# Altium schematic sheet 1700-0002_InterfaceBoard_RevA_0.SchDoc: 1700-0002_InterfaceBoard_RevA
size 897 x 577 mm; DRAWING_DATE: 4/15/2022; DRAWING_TITLE: PQI380 UNIV. INTERFACE BRD; PART_NUMBER: 7000-0303; REV: R12; Origin: Eagle; Date: 7/13/2023 2:16:40 PM; SheetNumber: 1; DWG-CO-NAME: DWG-CO-NAME; DWG-DATE: DWG-DATE; DWG-NUMBER: DWG-NUMBER; DWG-REV: DWG-REV; DWG-TITLE: DWG-TITLE; SIZE: SIZE; GateName_1: G$1; SymbolName_1: FRAME_D_L; LibraryName: frames; DeviceSetName: FRAME_D_L; Sheet: Sheet:
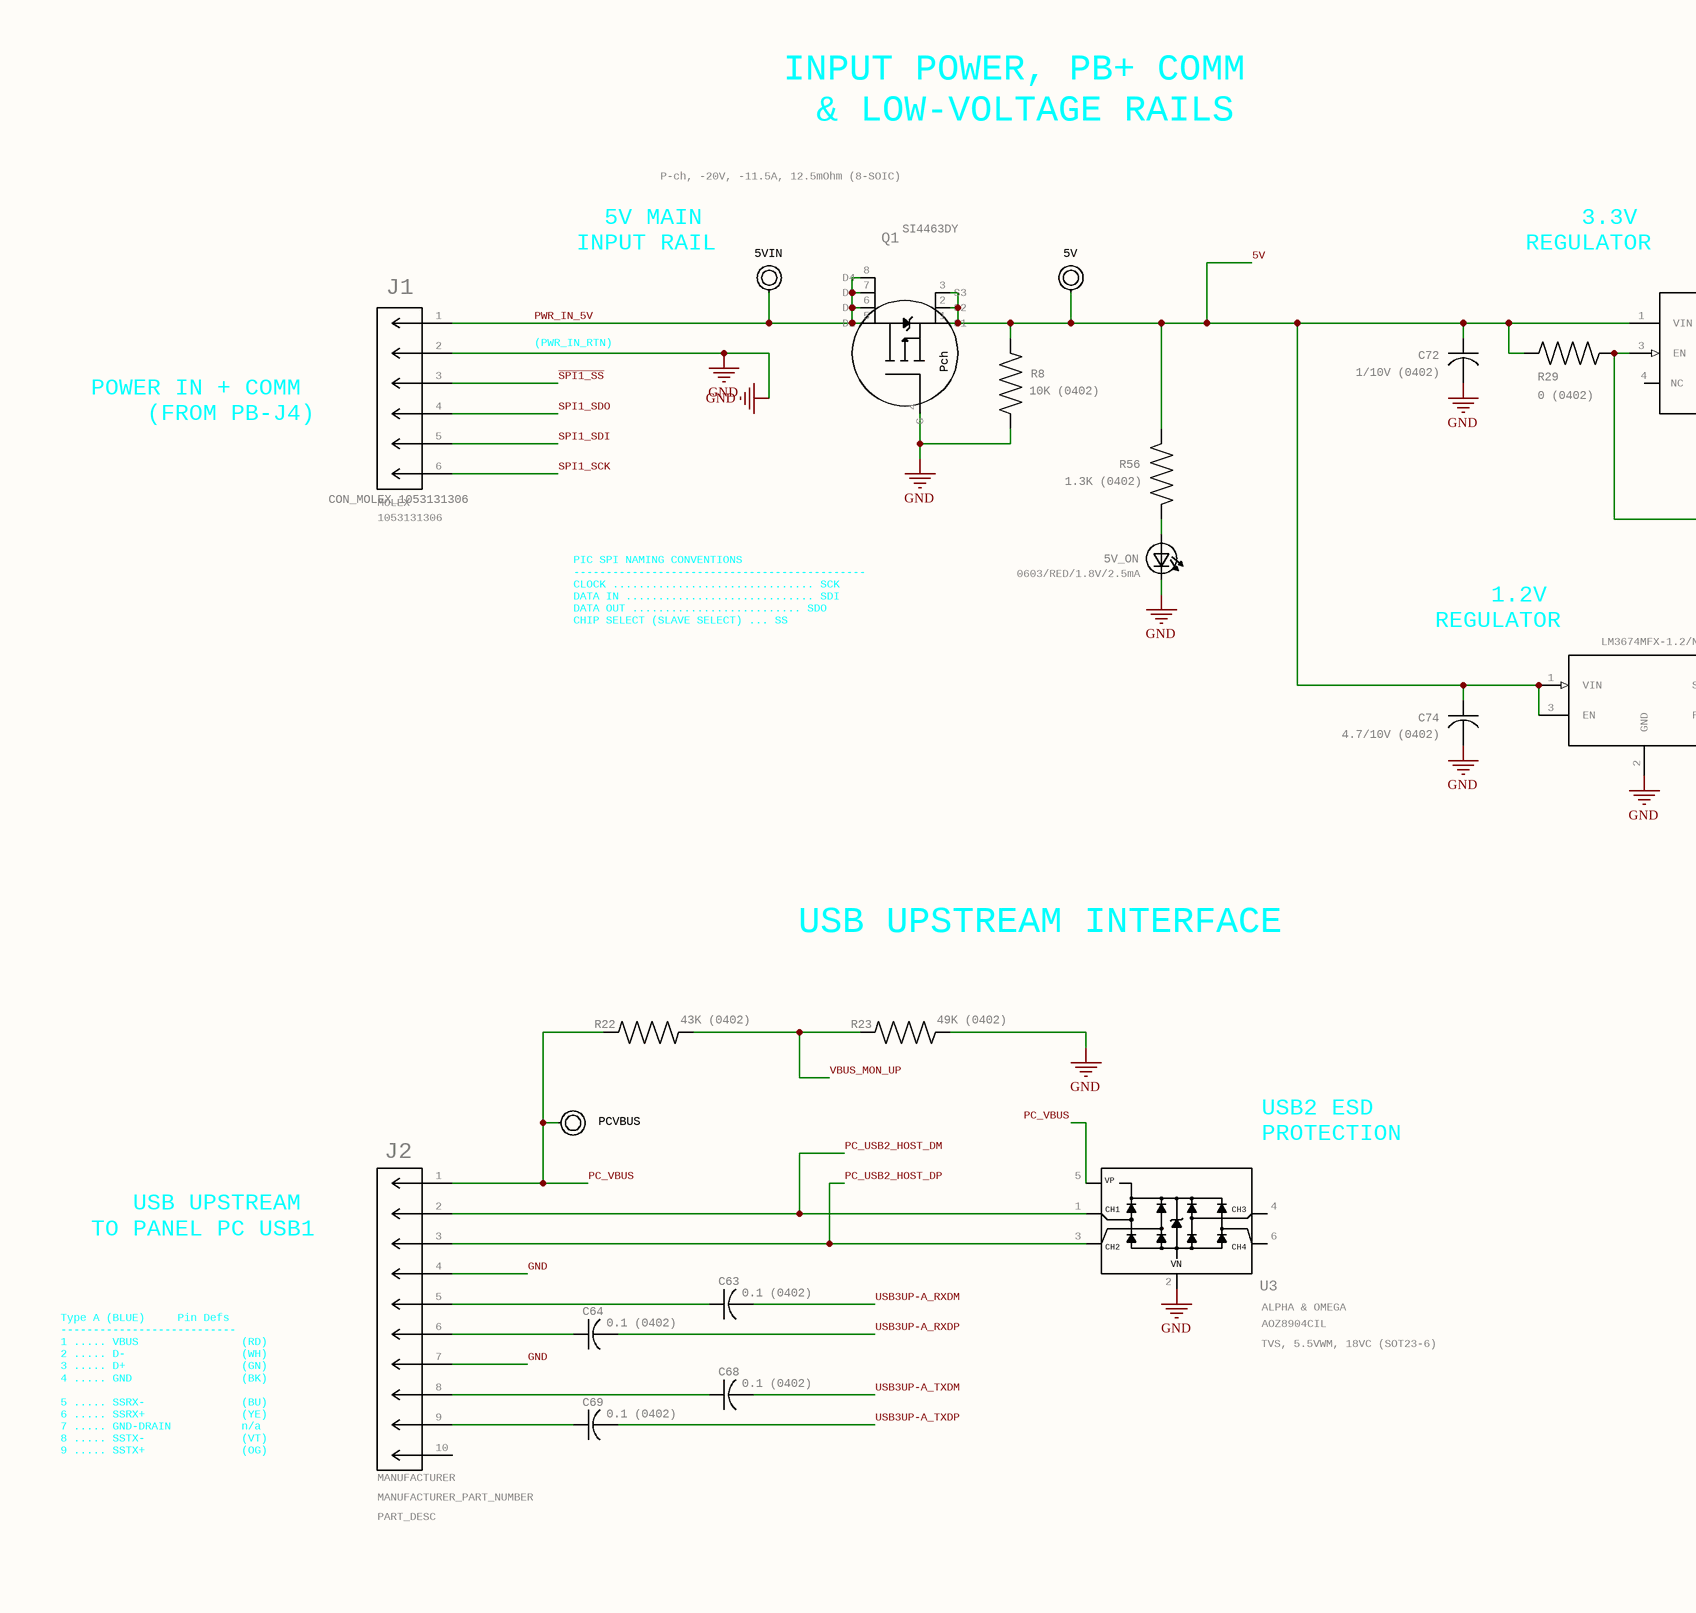
[diagram p0: 1700-0002_InterfaceBoard_RevA_0.SchDoc, top left]
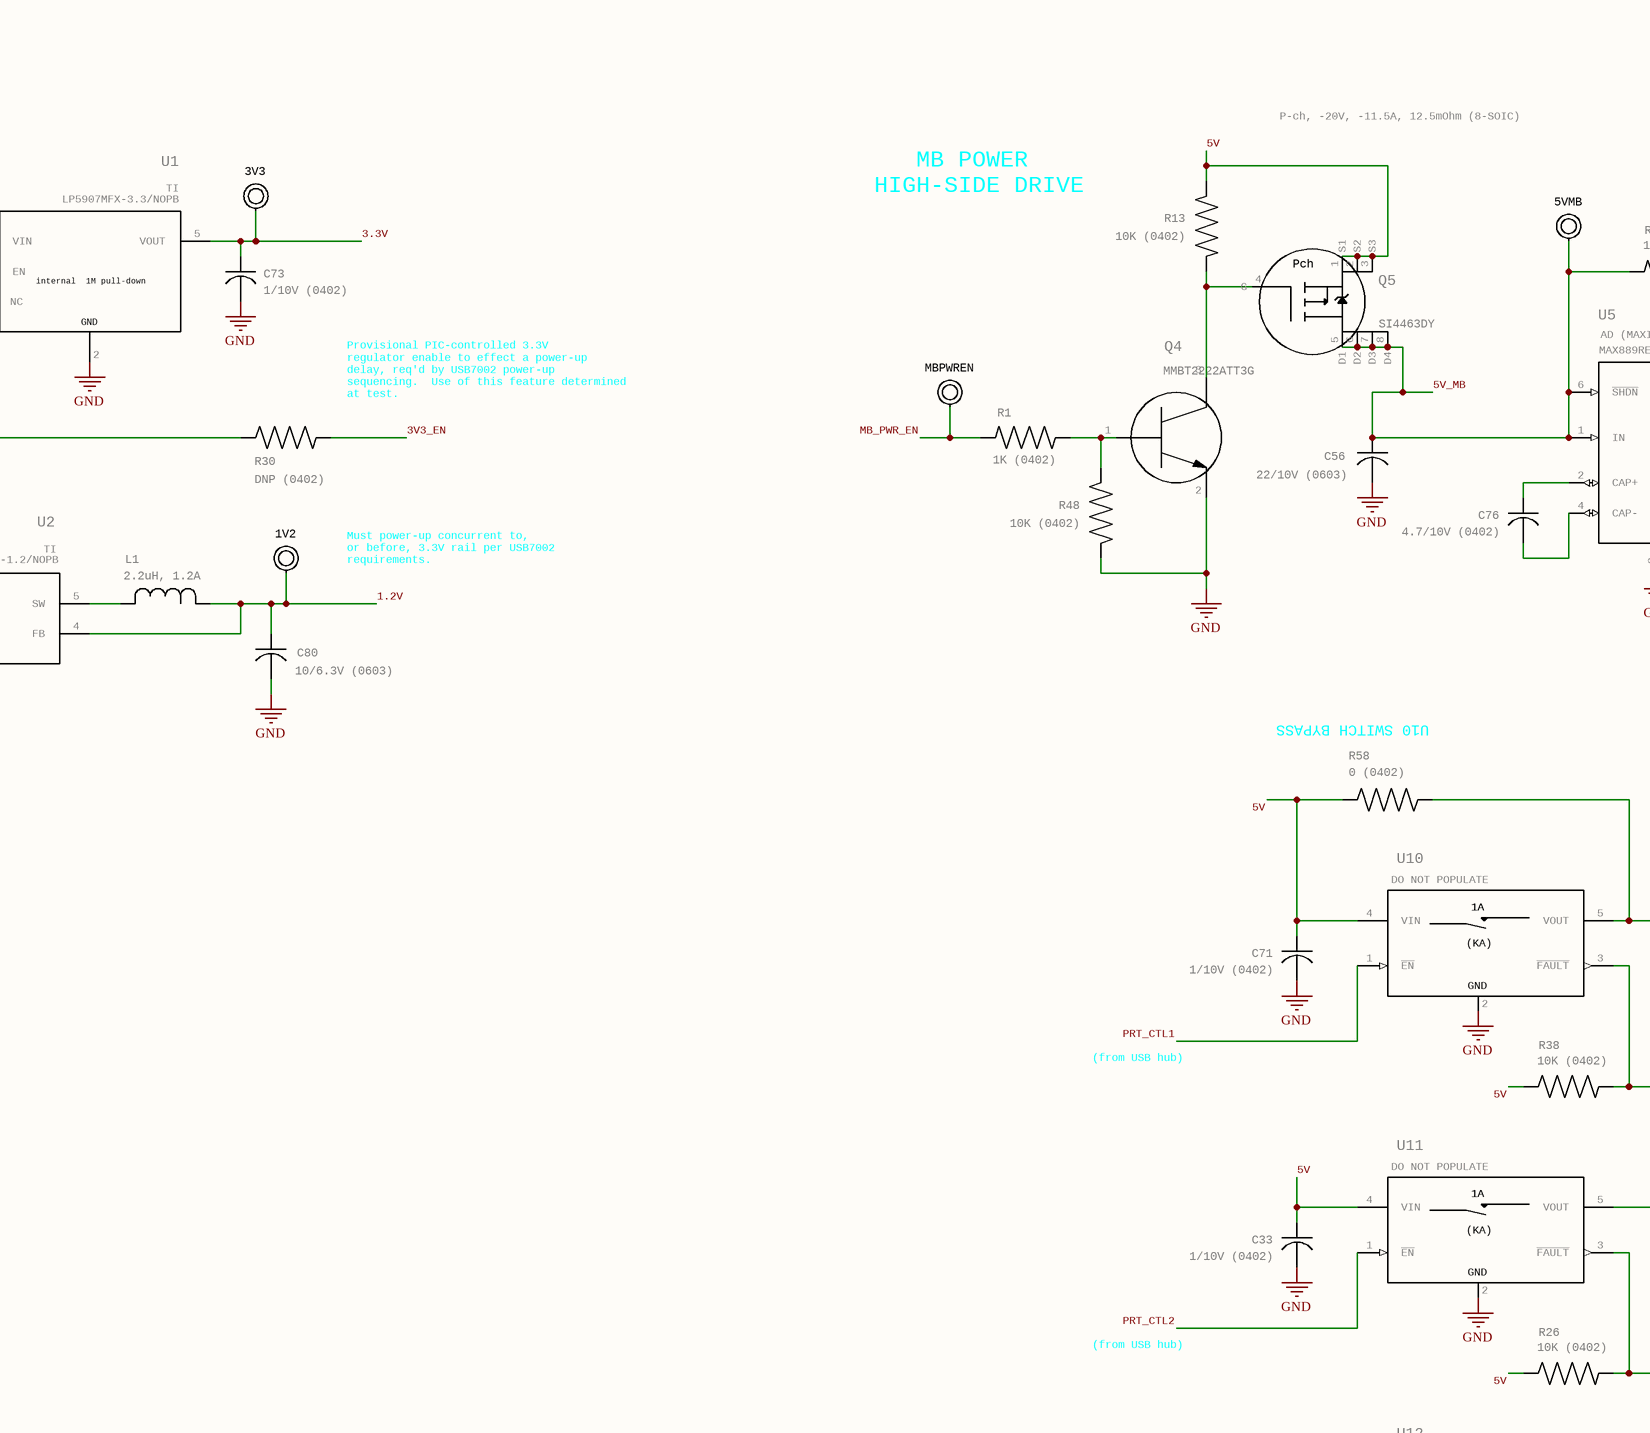
[diagram p1: 1700-0002_InterfaceBoard_RevA_0.SchDoc, top middle]
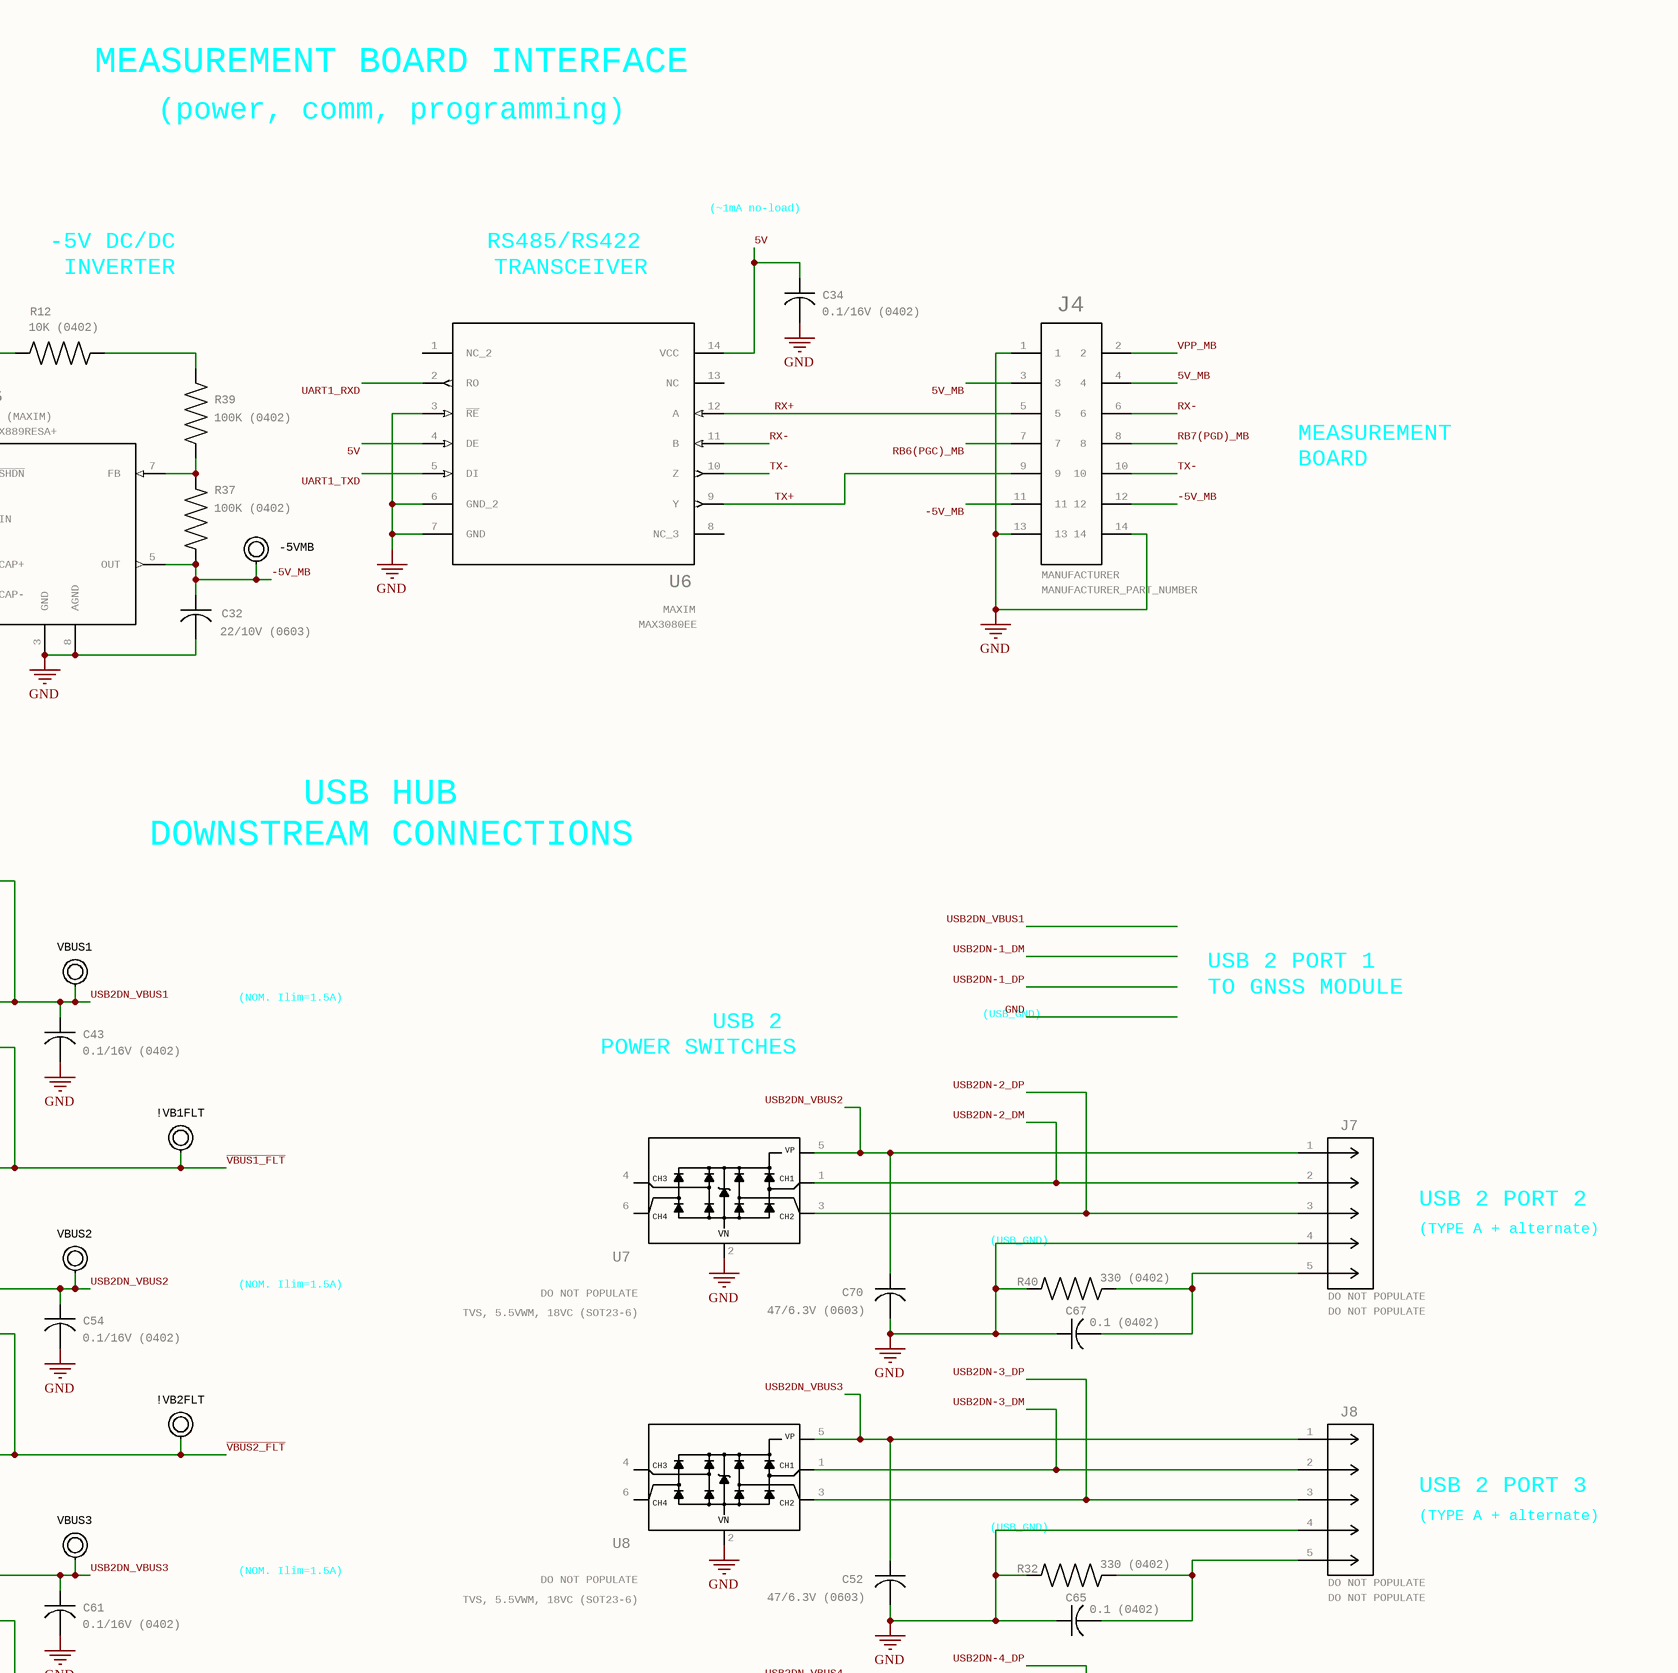
[diagram p2: 1700-0002_InterfaceBoard_RevA_0.SchDoc, top right]
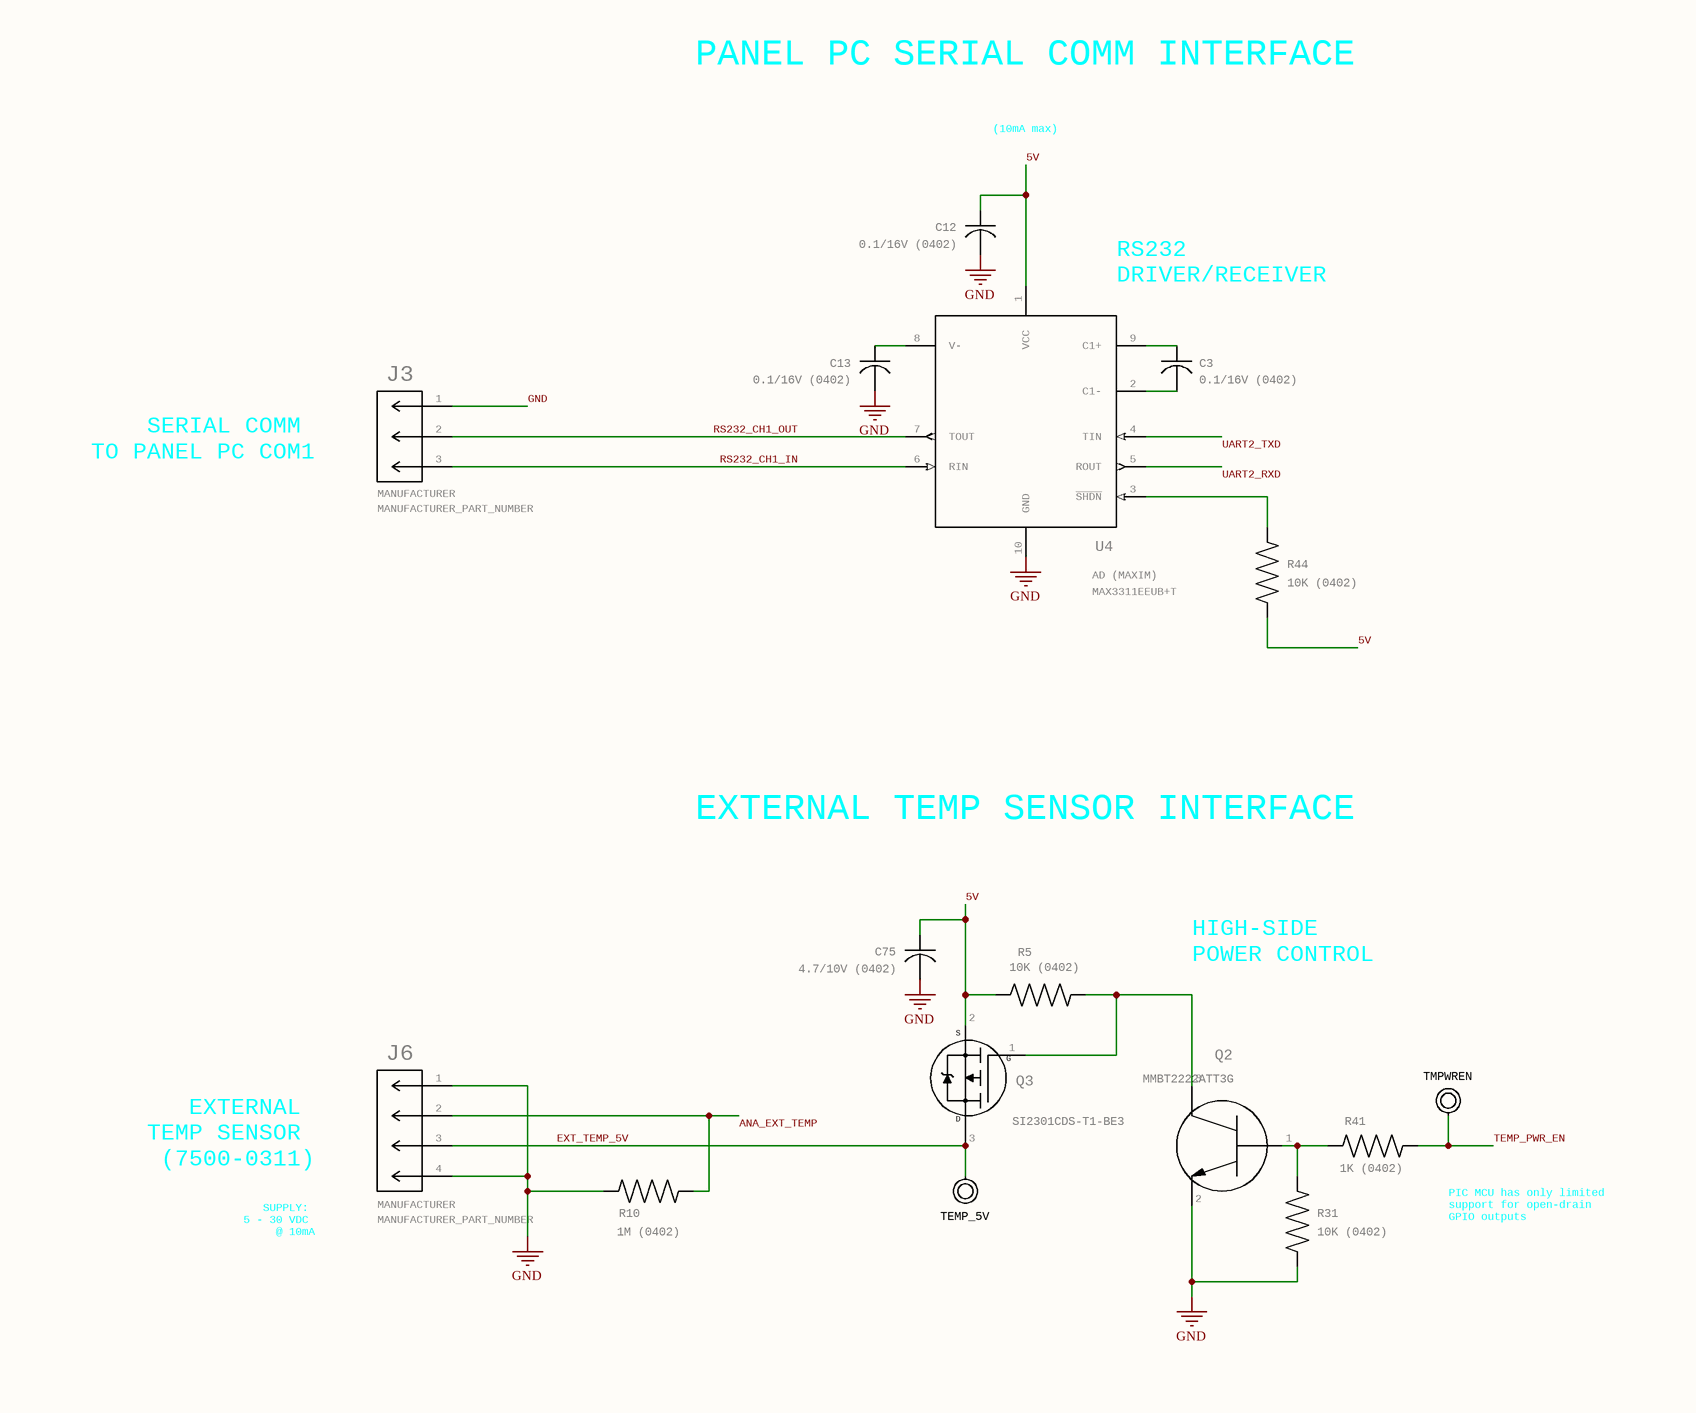
[diagram p3: 1700-0002_InterfaceBoard_RevA_0.SchDoc, bottom left]
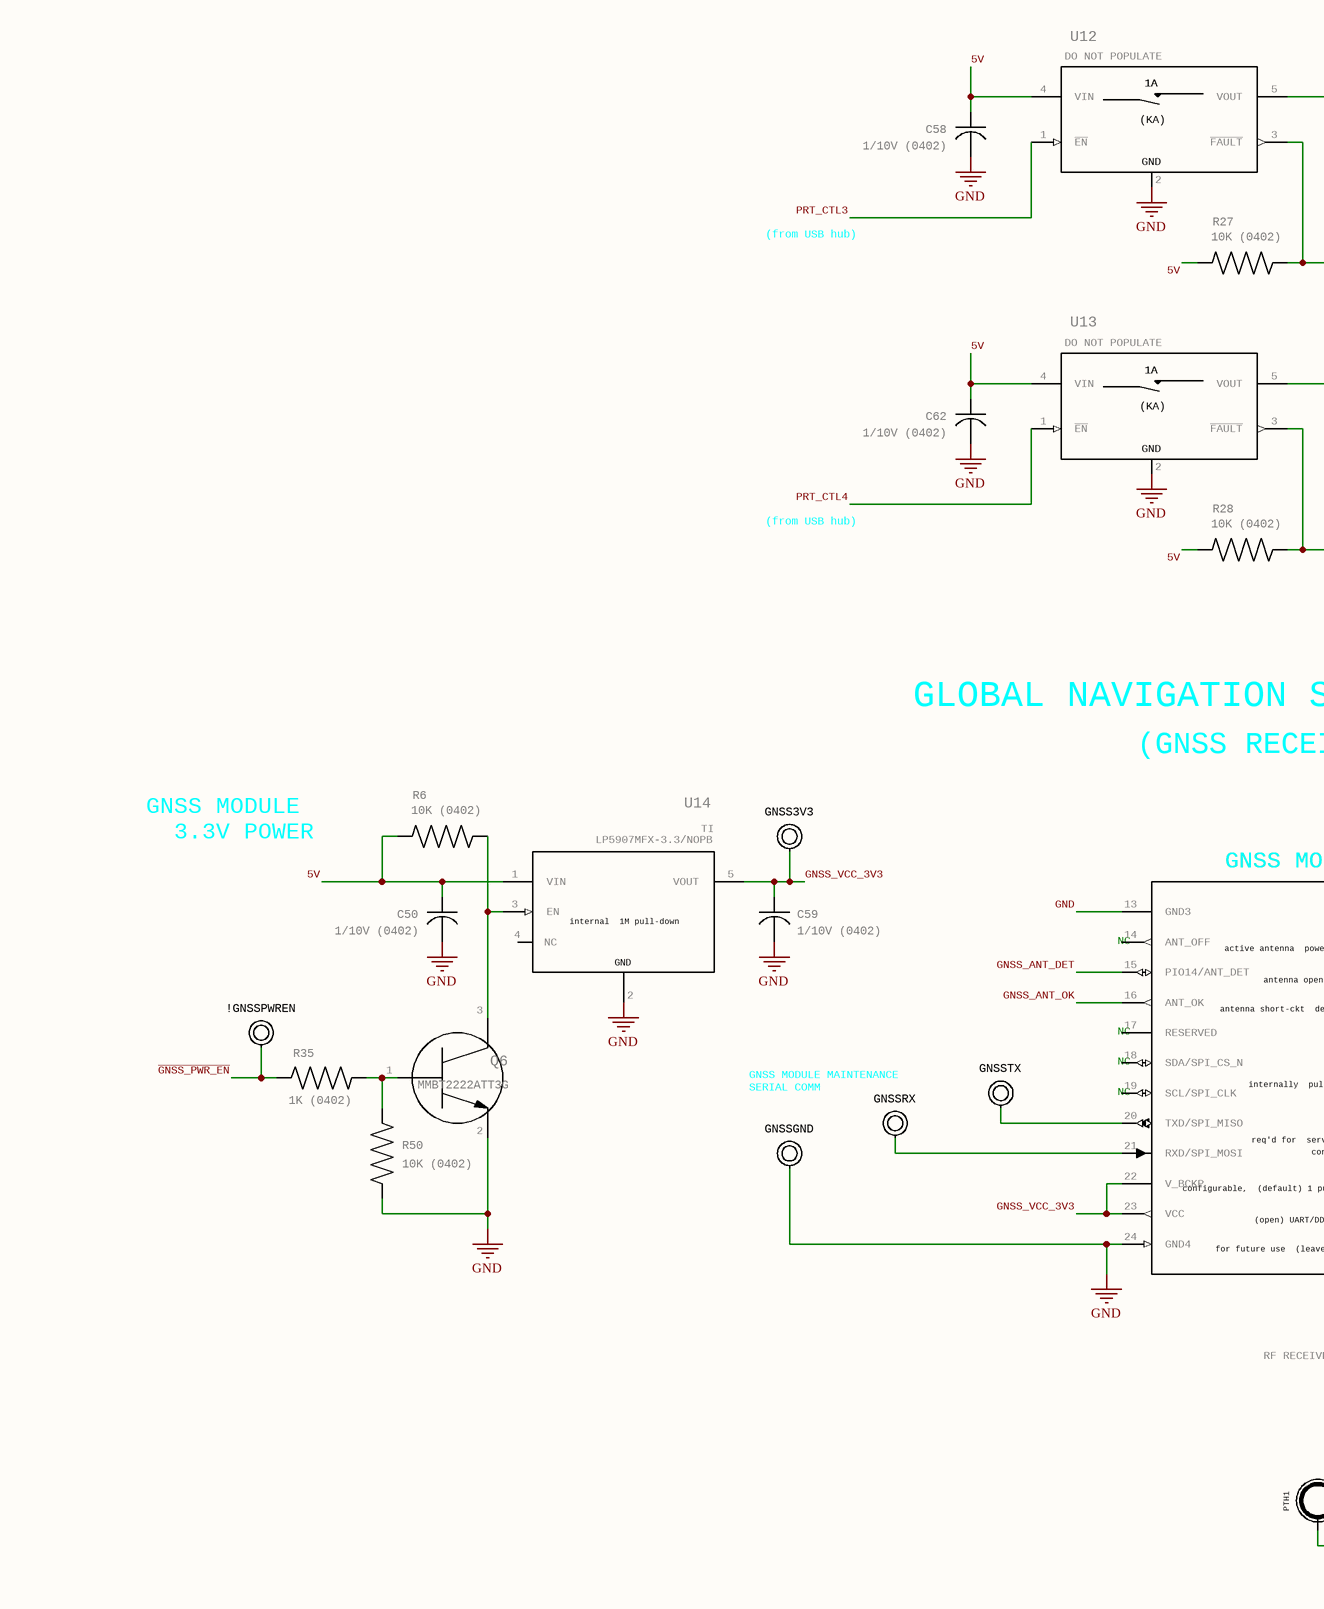
[diagram p4: 1700-0002_InterfaceBoard_RevA_0.SchDoc, bottom middle]
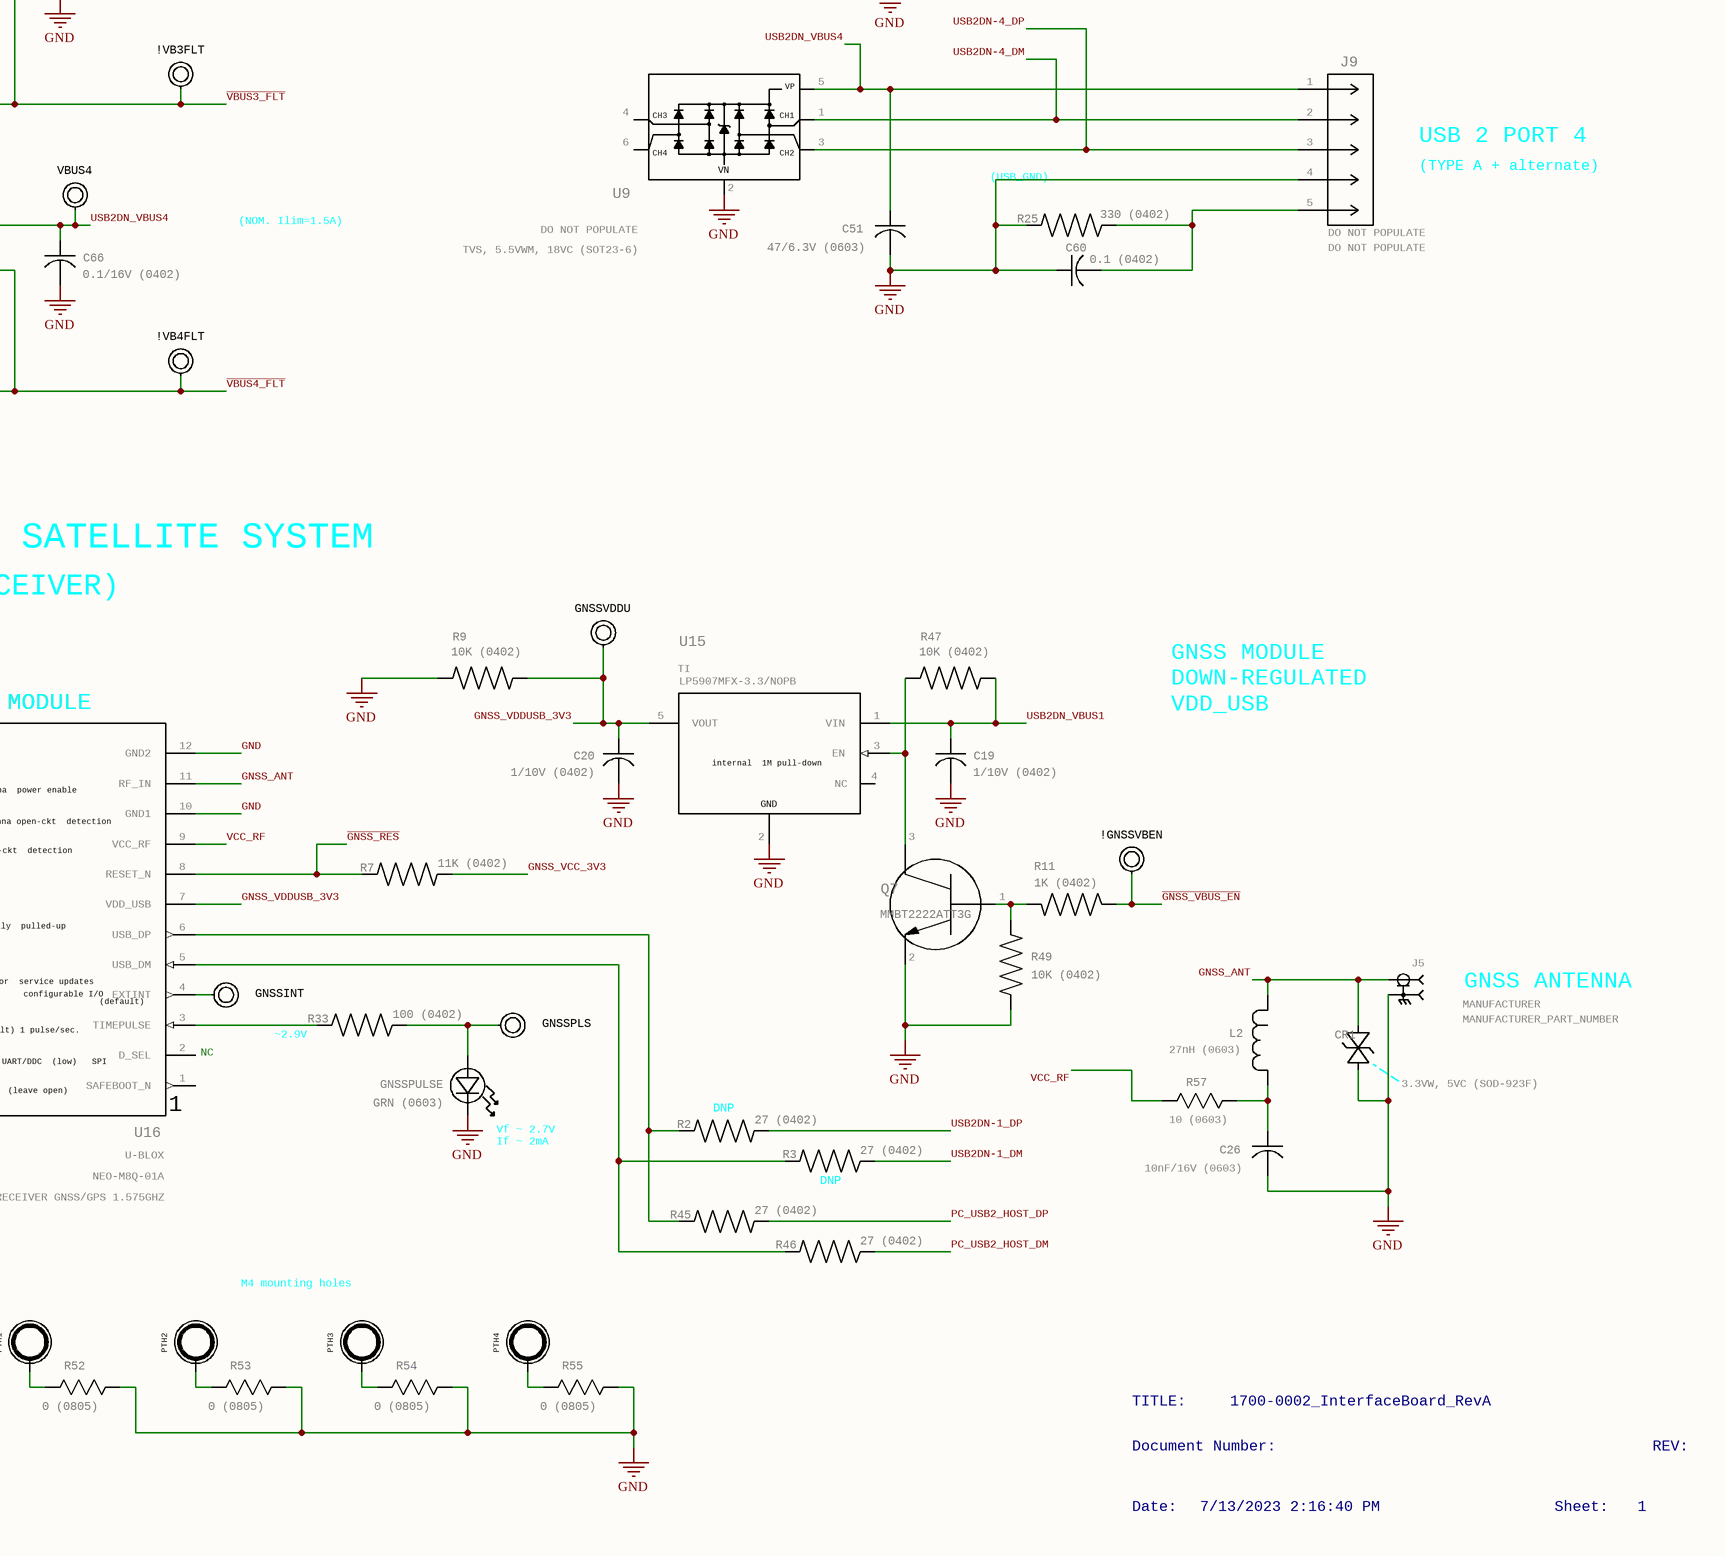
[diagram p5: 1700-0002_InterfaceBoard_RevA_0.SchDoc, bottom right]

## Parts
1V2  TST_POINT_PTH_042-OCT  [TST_POINT_PTH_042-OCT]  (value not drawn)
3V3  TST_POINT_PTH_042-OCT  [TST_POINT_PTH_042-OCT]  (value not drawn)
5V  TST_POINT_PTH_042-OCT  [TST_POINT_PTH_042-OCT]  (value not drawn)
5V_ON  0603/RED/1.8V/2.5mA  [LED_0603_LITE-ON]
5VIN  TST_POINT_PTH_042-OCT  [TST_POINT_PTH_042-OCT]  (value not drawn)
5VMB  TST_POINT_PTH_042-OCT  [TST_POINT_PTH_042-OCT]  (value not drawn)
!GNSSPWREN  TST_POINT_PTH_042-OCT  [TST_POINT_PTH_042-OCT]  (value not drawn)
!GNSSVBEN  TST_POINT_PTH_042-OCT  [TST_POINT_PTH_042-OCT]  (value not drawn)
!VB1FLT  TST_POINT_PTH_042-OCT  [TST_POINT_PTH_042-OCT]  (value not drawn)
!VB2FLT  TST_POINT_PTH_042-OCT  [TST_POINT_PTH_042-OCT]  (value not drawn)
!VB3FLT  TST_POINT_PTH_042-OCT  [TST_POINT_PTH_042-OCT]  (value not drawn)
!VB4FLT  TST_POINT_PTH_042-OCT  [TST_POINT_PTH_042-OCT]  (value not drawn)
-5VMB  TST_POINT_PTH_042-OCT  [TST_POINT_PTH_042-OCT]  (value not drawn)
C3  0.1/16V (0402)  [G-155_MUR]
C12  0.1/16V (0402)  [G-155_MUR]
C13  0.1/16V (0402)  [G-155_MUR]
C19  1/10V (0402)  [G-155_MUR]
C20  1/10V (0402)  [G-155_MUR]
C26  10nF/16V (0603)  [CAP_C1608_TDK]
C32  22/10V (0603)  [CAP_C1608_TDK]
C33  1/10V (0402)  [G-155_MUR]
C34  0.1/16V (0402)  [G-155_MUR]
C43  0.1/16V (0402)  [G-155_MUR]
C50  1/10V (0402)  [G-155_MUR]
C51  47/6.3V (0603)  [CAP_C1608_TDK]
C52  47/6.3V (0603)  [CAP_C1608_TDK]
C54  0.1/16V (0402)  [G-155_MUR]
C56  22/10V (0603)  [CAP_C1608_TDK]
C58  1/10V (0402)  [G-155_MUR]
C59  1/10V (0402)  [G-155_MUR]
C60  0.1 (0402)  [G-155_MUR]
C61  0.1/16V (0402)  [G-155_MUR]
C62  1/10V (0402)  [G-155_MUR]
C63  0.1 (0402)  [G-155_MUR]
C64  0.1 (0402)  [G-155_MUR]
C65  0.1 (0402)  [G-155_MUR]
C66  0.1/16V (0402)  [G-155_MUR]
C67  0.1 (0402)  [G-155_MUR]
C68  0.1 (0402)  [G-155_MUR]
C69  0.1 (0402)  [G-155_MUR]
C70  47/6.3V (0603)  [CAP_C1608_TDK]
C71  1/10V (0402)  [G-155_MUR]
C72  1/10V (0402)  [G-155_MUR]
C73  1/10V (0402)  [G-155_MUR]
C74  4.7/10V (0402)  [G-155_MUR]
C75  4.7/10V (0402)  [G-155_MUR]
C76  4.7/10V (0402)  [G-155_MUR]
C80  10/6.3V (0603)  [CAP_C1608_TDK]
CR1  3.3VW, 5VC (SOD-923F)  [SOD-923F_COMCHIP]
GNSS3V3  TST_POINT_PTH_042-OCT  [TST_POINT_PTH_042-OCT]  (value not drawn)
GNSSGND  TST_POINT_PTH_042-OCT  [TST_POINT_PTH_042-OCT]  (value not drawn)
GNSSINT  TST_POINT_PTH_042-OCT  [TST_POINT_PTH_042-OCT]  (value not drawn)
GNSSPLS  TST_POINT_PTH_042-OCT  [TST_POINT_PTH_042-OCT]  (value not drawn)
GNSSPULSE  GRN (0603)  [LED_DIALIGHT_598_DIA]
GNSSRX  TST_POINT_PTH_042-OCT  [TST_POINT_PTH_042-OCT]  (value not drawn)
GNSSTX  TST_POINT_PTH_042-OCT  [TST_POINT_PTH_042-OCT]  (value not drawn)
GNSSVDDU  TST_POINT_PTH_042-OCT  [TST_POINT_PTH_042-OCT]  (value not drawn)
J1  CON_MOLEX_1053131306  MANUFACTURER: MOLEX  MANUFACTURER_PART_NUMBER: 1053131306  [CON_1053131306]
J2  CON_MOLEX_1053141310  [CON_1053141310]  (value not drawn)
J3  CON_MOLEX_1053131303  [CON_1053131303]  (value not drawn)
J4  CON_3M_RA_N3314-5302RB  [3M_N3314-5302RB_RA]  (value not drawn)
J5  SAMTEC_SMA-J-P-X-ST-TH1_V.2  [SAMTEC_SMA-J-P-X-ST-TH1]  (value not drawn)
J6  CON_MOLEX_1053131304  [CON_1053131304]  (value not drawn)
J7  MANUFACTURER: DO NOT POPULATE  [CON_1054301305_MOL]  (hidden comment: CON_MOLEX_1054301305)
J8  MANUFACTURER: DO NOT POPULATE  [CON_1054301305_MOL]  (hidden comment: CON_MOLEX_1054301305)
J9  MANUFACTURER: DO NOT POPULATE  [CON_1054301305_MOL]  (hidden comment: CON_MOLEX_1054301305)
L1  2.2uH, 1.2A  [IND_TAIYO_NR3012_TAY]
L2  27nH (0603)  [INDUCTOR_0603_TDK]
MBPWREN  TST_POINT_PTH_042-OCT  [TST_POINT_PTH_042-OCT]  (value not drawn)
PCVBUS  TST_POINT_PTH_042-OCT  [TST_POINT_PTH_042-OCT]  (value not drawn)
PTH1  PTH_M4_4.5MM-ID_MIDDLE-FIT  [PTH_M4_4.5MM-ID]  (value not drawn)
PTH2  PTH_M4_4.5MM-ID_MIDDLE-FIT  [PTH_M4_4.5MM-ID]  (value not drawn)
PTH3  PTH_M4_4.5MM-ID_MIDDLE-FIT  [PTH_M4_4.5MM-ID]  (value not drawn)
PTH4  PTH_M4_4.5MM-ID_MIDDLE-FIT  [PTH_M4_4.5MM-ID]  (value not drawn)
Q1  P-ch, -20V, -11.5A, 12.5mOhm (8-SOIC)  MANUFACTURER_PART_NUMBER: SI4463DY  [SO-8L-NB_FAS]
Q2  MMBT2222ATT3G  [SC-75(SOT-416)_ONSEMI]
Q3  MANUFACTURER_PART_NUMBER: SI2301CDS-T1-BE3  [SOT_1CDS-T1-BE3_VIS]  (hidden comment: P-CH/-20V/-3A/0.09OHM)
Q4  MMBT2222ATT3G  [SC-75(SOT-416)_ONSEMI]
Q5  P-ch, -20V, -11.5A, 12.5mOhm (8-SOIC)  MANUFACTURER_PART_NUMBER: SI4463DY  [SO-8L-NB_FAS]
Q6  MMBT2222ATT3G  [SC-75(SOT-416)_ONSEMI]
Q7  MMBT2222ATT3G  [SC-75(SOT-416)_ONSEMI]
R1  1K (0402)  [RESC1005X35N]
R2  27 (0402)  [RESC1005X35N]
R3  27 (0402)  [RESC1005X35N]
R5  10K (0402)  [RESC1005X35N]
R6  10K (0402)  [RESC1005X35N]
R7  11K (0402)  [RESC1005X35N]
R8  10K (0402)  [RESC1005X35N]
R9  10K (0402)  [RESC1005X35N]
R10  1M (0402)  [RESC1005X35N]
R11  1K (0402)  [RESC1005X35N]
R12  10K (0402)  [RESC1005X35N]
R13  10K (0402)  [RESC1005X35N]
R22  43K (0402)  [RESC1005X35N]
R23  49K (0402)  [RESC1005X35N]
R25  330 (0402)  [RESC1005X35N]
R26  10K (0402)  [RESC1005X35N]
R27  10K (0402)  [RESC1005X35N]
R28  10K (0402)  [RESC1005X35N]
R29  0 (0402)  [RESC1005X35N]
R30  DNP (0402)  [RESC1005X35N]
R31  10K (0402)  [RESC1005X35N]
R32  330 (0402)  [RESC1005X35N]
R33  100 (0402)  [RESC1005X35N]
R35  1K (0402)  [RESC1005X35N]
R37  100K (0402)  [RESC1005X35N]
R38  10K (0402)  [RESC1005X35N]
R39  100K (0402)  [RESC1005X35N]
R40  330 (0402)  [RESC1005X35N]
R41  1K (0402)  [RESC1005X35N]
R44  10K (0402)  [RESC1005X35N]
R45  27 (0402)  [RESC1005X35N]
R46  27 (0402)  [RESC1005X35N]
R47  10K (0402)  [RESC1005X35N]
R48  10K (0402)  [RESC1005X35N]
R49  10K (0402)  [RESC1005X35N]
R50  10K (0402)  [RESC1005X35N]
R52  0 (0805)  [STA_HCJ0805_STP]
R53  0 (0805)  [STA_HCJ0805_STP]
R54  0 (0805)  [STA_HCJ0805_STP]
R55  0 (0805)  [STA_HCJ0805_STP]
R56  1.3K (0402)  [RESC1005X35N]
R57  10 (0603)  [STA_RMCF0603_STP]
R58  0 (0402)  [RESC1005X35N]
TEMP_5V  TST_POINT_PTH_042-OCT  [TST_POINT_PTH_042-OCT]  (value not drawn)
TMPWREN  TST_POINT_PTH_042-OCT  [TST_POINT_PTH_042-OCT]  (value not drawn)
U1  internal
1Mpull-down: internal / 1M pull-down  MANUFACTURER: TI  MANUFACTURER_PART_NUMBER: LP5907MFX-3.3/NOPB  [DBV0005A_L]  (hidden comment: TI_LP5907MFX-3.3/NOPBDBV0005A_L)
U2  MANUFACTURER: TI  MANUFACTURER_PART_NUMBER: LM3674MFX-1.2/NOPB  [DBV5_TEX]  (hidden comment: TI_SW-REG_LM3671)
U3  TVS, 5.5VWM, 18VC (SOT23-6)  MANUFACTURER: ALPHA & OMEGA  MANUFACTURER_PART_NUMBER: AOZ8904CIL  [SOT-23-6_AOS]
U4  MANUFACTURER: AD (MAXIM)  MANUFACTURER_PART_NUMBER: MAX3311EEUB+T  [21-0061L_MXM]  (hidden comment: MAXIM_MAX3311EEUB+T)
U5  MANUFACTURER: AD (MAXIM)  MANUFACTURER_PART_NUMBER: MAX889RESA+  [SOIC127P600X175-8N]  (hidden comment: MAXIM_MAX889RESA)
U6  MANUFACTURER: MAXIM  MANUFACTURER_PART_NUMBER: MAX3080EE  [21-0041B_14_MXM]  (hidden comment: MAX3080EESD+)
U7  TVS, 5.5VWM, 18VC (SOT23-6)  MANUFACTURER_PART_NUMBER: DO NOT POPULATE  [SOT-23-6_AOS]
U8  TVS, 5.5VWM, 18VC (SOT23-6)  MANUFACTURER_PART_NUMBER: DO NOT POPULATE  [SOT-23-6_AOS]
U9  TVS, 5.5VWM, 18VC (SOT23-6)  MANUFACTURER_PART_NUMBER: DO NOT POPULATE  [SOT-23-6_AOS]
U10  MANUFACTURER_PART_NUMBER: DO NOT POPULATE  [TSOT-25_DIODES-INC]  (hidden comment: SW_PWR_1CH_DIODES-INC_AP22816BKAWT)
U11  MANUFACTURER_PART_NUMBER: DO NOT POPULATE  [TSOT-25_DIODES-INC]  (hidden comment: SW_PWR_1CH_DIODES-INC_AP22816BKAWT)
U12  MANUFACTURER_PART_NUMBER: DO NOT POPULATE  [TSOT-25_DIODES-INC]  (hidden comment: SW_PWR_1CH_DIODES-INC_AP22816BKAWT)
U13  MANUFACTURER_PART_NUMBER: DO NOT POPULATE  [TSOT-25_DIODES-INC]  (hidden comment: SW_PWR_1CH_DIODES-INC_AP22816BKAWT)
U14  internal
1Mpull-down: internal / 1M pull-down  MANUFACTURER: TI  MANUFACTURER_PART_NUMBER: LP5907MFX-3.3/NOPB  [DBV0005A_L]  (hidden comment: TI_LP5907MFX-3.3/NOPBDBV0005A_L)
U15  internal
1Mpull-down: internal / 1M pull-down  MANUFACTURER: TI  MANUFACTURER_PART_NUMBER: LP5907MFX-3.3/NOPB  [DBV0005A_L]  (hidden comment: TI_LP5907MFX-3.3/NOPBDBV0005A_L)
U16  antennaopen-ckt
detection: antenna open-ckt / detection  antennashort-ckt
detection: antenna short-ckt / detection  activeantenna
powerenable: active antenna / power enable  internally
pulled-up: internally / pulled-up  req'dfor
serviceupdates: req'd for / service updates  forfutureuse
(leaveopen): for future use / (leave open)  (open)UART/DDC
(low)SPI: (open) UART/DDC / (low)   SPI  configurable,
(default)1pulse/sec.: configurable, / (default) 1 pulse/sec.  configurableI/O: configurable I/O  MANUFACTURER: U-BLOX  MANUFACTURER_PART_NUMBER: NEO-M8Q-01A  PART_DESC: RF RECEIVER GNSS/GPS 1.575GHZ  [UBLOX_24LCC]  (hidden comment: MODULE_UBLOX_NEO-M8Q-01A)
VBUS1  TST_POINT_PTH_042-OCT  [TST_POINT_PTH_042-OCT]  (value not drawn)
VBUS2  TST_POINT_PTH_042-OCT  [TST_POINT_PTH_042-OCT]  (value not drawn)
VBUS3  TST_POINT_PTH_042-OCT  [TST_POINT_PTH_042-OCT]  (value not drawn)
VBUS4  TST_POINT_PTH_042-OCT  [TST_POINT_PTH_042-OCT]  (value not drawn)

## Nets
GND: 5V_ON.1(K2) C12.2 C13.2 C19.2 C20.2 C26.2 C32.2 C33.2 C34.2 C43.2 C50.2 C51.2 C52.2 C54.2 C56.2 C58.2 C59.2 C60.1 C61.2 C62.2 C65.1 C66.2 C67.1 C70.2 C71.2 C72.2 C73.2 C74.2 C75.2 C80.2 CR1.2(K) GNSSGND.P$1 GNSSPULSE.1 J1.2 J2.4 J2.7 J3.1 J4.1 J4.13 J4.14 J5.2-5 J6.1 J6.4 J7.4 J8.4 J9.4 Q1.4(G) Q2.2(E) Q4.2(E) Q6.2(E) Q7.2(E) R8.1 R9.2 R10.2 R23.1 R25.2 R31.2 R32.2 R40.2 R48.2 R49.2 R50.2 R52.1 R53.1 R54.1 R55.1 U1.2(GND) U2.2(GND) U3.2(VN) U4.10(GND) U5.3(GND) U5.8(AGND) U6.3(~{RE}) U6.6(GND_2) U6.7(GND) U7.2(VN) U8.2(VN) U9.2(VN) U10.2(GND) U11.2(GND) U12.2(GND) U13.2(GND) U14.2(GND) U15.2(GND) U16.10(GND1) U16.12(GND2) U16.13(GND3) U16.24(GND4)
1.2V: 1V2.P$1 C80.1 L1.1 U2.4(FB)
3.3V: 3V3.P$1 C73.1 U1.5(VOUT)
3V3_EN: R30.2
5V: 5V.P$1 C12.1 C33.1 C34.1 C50.1 C58.1 C62.1 C71.1 C72.1 C74.1 C75.1 Q1.1(S1) Q1.2(S2) Q1.3(S3) Q3.2(S) Q5.1(S1) Q5.2(S2) Q5.3(S3) R5.2 R6.2 R8.2 R13.1 R26.2 R27.2 R28.2 R29.1 R38.2 R44.2 R56.2 R58.1 U1.1(VIN) U2.1(VIN) U2.3(EN) U4.1(VCC) U6.4(DE) U6.14(VCC) U10.4(VIN) U11.4(VIN) U12.4(VIN) U13.4(VIN) U14.1(VIN)
5V_MB: 5VMB.P$1 C56.1 J4.3 J4.4 Q5.5(D1) Q5.6(D2) Q5.7(D3) Q5.8(D4) R12.2 U5.1(IN) U5.6(~{SHDN})
-5V_MB: -5VMB.P$1 C32.1 J4.11 J4.12 R37.2 U5.5(OUT)
ANA_EXT_TEMP: J6.2 R10.1
EXT_TEMP_5V: J6.3 Q3.3(D) TEMP_5V.P$1
~{GNSS_PWR_EN}: !GNSSPWREN.P$1 R35.1
~{GNSS_RES}: R7.1 U16.8(RESET_N)
~{GNSS_VBUS_EN}: !GNSSVBEN.P$1 R11.1
GNSS_ANT: CR1.1(A) J5.1 L2.1 U16.11(RF_IN)
GNSS_ANT_DET: U16.15(PIO14/ANT_DET)
GNSS_ANT_OK: U16.16(ANT_OK)
GNSS_VCC_3V3: C59.1 GNSS3V3.P$1 R7.2 U14.5(VOUT) U16.22(V_BCKP) U16.23(VCC)
GNSS_VDDUSB_3V3: C20.1 GNSSVDDU.P$1 R9.1 U15.5(VOUT) U16.7(VDD_USB)
MB_PWR_EN: MBPWREN.P$1 R1.1
PC_USB2_HOST_DM: J2.2 R46.2 U3.1(CH1)
PC_USB2_HOST_DP: J2.3 R45.2 U3.3(CH2)
PC_VBUS: J2.1 PCVBUS.P$1 R22.2 U3.5(VP)
PRT_CTL1: U10.1(~{EN})
PRT_CTL2: U11.1(~{EN})
PRT_CTL3: U12.1(~{EN})
PRT_CTL4: U13.1(~{EN})
PWR_IN_5V: 5VIN.P$1 J1.1 Q1.5(D1) Q1.6(D2) Q1.7(D3) Q1.8(D4)
RB6(PGC)_MB: J4.7
RB7(PGD)_MB: J4.8
RS232_CH1_IN: J3.3 U4.6(RIN)
RS232_CH1_OUT: J3.2 U4.7(TOUT)
RX+: J4.5 U6.12(A)
RX-: J4.6 U6.11(B)
~{SPI1_SS}: J1.3
SPI1_SCK: J1.6
SPI1_SDI: J1.5
SPI1_SDO: J1.4
TEMP_PWR_EN: R41.2 TMPWREN.P$1
TX+: J4.9 U6.9(Y)
TX-: J4.10 U6.10(Z)
UART1_RXD: U6.2(RO)
UART1_TXD: U6.5(DI)
UART2_RXD: U4.5(ROUT)
UART2_TXD: U4.4(TIN)
USB2DN-1_DM: R3.2
USB2DN-1_DP: R2.2
USB2DN-2_DM: J7.2 U7.1(CH1)
USB2DN-2_DP: J7.3 U7.3(CH2)
USB2DN-3_DM: J8.2 U8.1(CH1)
USB2DN-3_DP: J8.3 U8.3(CH2)
USB2DN-4_DM: J9.2 U9.1(CH1)
USB2DN-4_DP: J9.3 U9.3(CH2)
USB2DN_VBUS1: C19.1 C43.1 R47.1 R58.2 U10.5(VOUT) U15.1(VIN) VBUS1.P$1
USB2DN_VBUS2: C54.1 C70.1 J7.1 U7.5(VP) U11.5(VOUT) VBUS2.P$1
USB2DN_VBUS3: C52.1 C61.1 J8.1 U8.5(VP) U12.5(VOUT) VBUS3.P$1
USB2DN_VBUS4: C51.1 C66.1 J9.1 U9.5(VP) U13.5(VOUT) VBUS4.P$1
USB3UP-A_RXDM: C63.2
USB3UP-A_RXDP: C64.2
USB3UP-A_TXDM: C68.2
USB3UP-A_TXDP: C69.2
~{VBUS1_FLT}: !VB1FLT.P$1 R38.1 U10.3(~{FAULT})
~{VBUS2_FLT}: !VB2FLT.P$1 R26.1 U11.3(~{FAULT})
~{VBUS3_FLT}: !VB3FLT.P$1 R27.1 U12.3(~{FAULT})
~{VBUS4_FLT}: !VB4FLT.P$1 R28.1 U13.3(~{FAULT})
VBUS_MON_UP: R22.1 R23.2
VCC_RF: R57.2 U16.9(VCC_RF)
VPP_MB: J4.2
Net5V_ON_2: 5V_ON.2(A2) R56.1
NetC3_1: C3.1 U4.9(C1+)
NetC3_2: C3.2 U4.2(C1-)
NetC13_1: C13.1 U4.8(V-)
NetC26_1: C26.1 L2.2 R57.1
NetC60_2: C60.2 J9.5 R25.1
NetC63_1: C63.1 J2.5
NetC64_1: C64.1 J2.6
NetC65_2: C65.2 J8.5 R32.1
NetC67_2: C67.2 J7.5 R40.1
NetC68_1: C68.1 J2.8
NetC69_1: C69.1 J2.9
NetC76_1: C76.1 U5.2(CAP+)
NetC76_2: C76.2 U5.4(CAP-)
NetGNSSINT_P$1: GNSSINT.P$1 U16.4(EXTINT)
NetGNSSPLS_P$1: GNSSPLS.P$1 GNSSPULSE.2 R33.2
NetGNSSRX_P$1: GNSSRX.P$1 U16.21(RXD/SPI_MOSI)
NetGNSSTX_P$1: GNSSTX.P$1 U16.20(TXD/SPI_MISO)
NetL1_2: L1.2 U2.5(SW)
NetPTH1_P$1: PTH1.P$1 R52.2
NetPTH2_P$1: PTH2.P$1 R53.2
NetPTH3_P$1: PTH3.P$1 R54.2
NetPTH4_P$1: PTH4.P$1 R55.2
NetQ2_1: Q2.1(B) R31.1 R41.1
NetQ2_3: Q2.3(C) Q3.1(G) R5.1
NetQ4_1: Q4.1(B) R1.2 R48.1
NetQ4_3: Q4.3(C) Q5.4(G) R13.2
NetQ6_1: Q6.1(B) R35.2 R50.1
NetQ6_3: Q6.3(C) R6.1 U14.3(EN)
NetQ7_1: Q7.1(B) R11.2 R49.1
NetQ7_3: Q7.3(C) R47.2 U15.3(EN)
NetR2_1: R2.1 R45.1 U16.6(USB_DP)
NetR3_1: R3.1 R46.1 U16.5(USB_DM)
NetR12_1: R12.1 R39.1
NetR29_2: R29.2 R30.1 U1.3(EN)
NetR33_1: R33.1 U16.3(TIMEPULSE)
NetR37_1: R37.1 R39.2 U5.7(FB)
NetR44_1: R44.1 U4.3(~{SHDN})

Not connected (* = marked no-connect by the designer): J2 10; U1 4(NC); U3 4(CH3) 6(CH4); U6 1(NC_2) 8(NC_3) 13(NC); U7 4(CH3) 6(CH4); U8 4(CH3) 6(CH4); U9 4(CH3) 6(CH4); U14 4(NC); U15 4(NC); U16 1(SAFEBOOT_N) 2(D_SEL) 14(ANT_OFF) 17(RESERVED) 18(SDA/SPI_CS_N) 19(SCL/SPI_CLK)

## Notes on the sheet
- MEASUREMENT BOARD INTERFACE
- INPUT POWER, PB+ COMM
  & LOW-VOLTAGE RAILS
- (power, comm, programming)
- (~1mA no-load)
- 5V MAIN
  INPUT RAIL
- 3.3V
  REGULATOR
- MB POWER
  HIGH-SIDE DRIVE
- -5V DC/DC
  INVERTER
- RS485/RS422
  TRANSCEIVER
- (PWR_IN_RTN)
- POWER IN + COMM
  (FROM PB-J4)
- (near R30) Provisional PIC-controlled 3.3V
  regulator enable to effect a power-up
  delay, req'd by USB7002 power-up
  sequencing.  Use of this feature determined
  at test.
- MEASUREMENT
  BOARD
- PIC SPI NAMING CONVENTIONS
  ---------------------------------------------
  CLOCK ............................... SCK
  DATA IN ............................. SDI
  DATA OUT .......................... SDO
  CHIP SELECT (SLAVE SELECT) ... SS
- 1.2V
  REGULATOR
- Must power-up concurrent to,
  or before, 3.3V rail per USB7002
  requirements.
- U10 SWITCH BYPASS
- USB HUB
  DOWNSTREAM CONNECTIONS
- USB UPSTREAM INTERFACE
- (NOM. Ilim=1.5A)
- USB 2
  POWER SWITCHES
- (USB_GND)
- USB 2 PORT 1
  TO GNSS MODULE
- (near U3) USB2 ESD
  PROTECTION
- (from USB hub)
- USB 2 PORT 2
- USB UPSTREAM
  TO PANEL PC USB1
- (TYPE A + alternate)
- Type A (BLUE)     Pin Defs
  ---------------------------
  1 ..... VBUS
  2 ..... D-
  3 ..... D+
  4 ..... GND
  5 ..... SSRX-
  6 ..... SSRX+
  7 ..... GND-DRAIN
  8 ..... SSTX-
  9 ..... SSTX+
- (RD)
  (WH)
  (GN)
  (BK)
  (BU)
  (YE)
  n/a
  (VT)
  (OG)
- USB 2 PORT 3
- PANEL PC SERIAL COMM INTERFACE
- (10mA max)
- USB 2 PORT 4
- (near U4) RS232
  DRIVER/RECEIVER
- SERIAL COMM
  TO PANEL PC COM1
- GLOBAL NAVIGATION SATELLITE SYSTEM
- (GNSS RECEIVER)
- GNSS MODULE
  3.3V POWER
- EXTERNAL TEMP SENSOR INTERFACE
- (near U16) GNSS MODULE
- GNSS MODULE
  DOWN-REGULATED
  VDD_USB
- (near U16) NC
- HIGH-SIDE
  POWER CONTROL
- GNSS MODULE MAINTENANCE
  SERIAL COMM
- (near J5) GNSS ANTENNA
- NC
- (near R33) ~2.9V
- EXTERNAL
  TEMP SENSOR
  (7500-0311)
- PIC MCU has only limited
  support for open-drain
  GPIO outputs
- (near GNSSPULSE) Vf ~ 2.7V
  If ~ 2mA
- (near R2) DNP
- SUPPLY:
  5 - 30 VDC
  @ 10mA
- (near R3) DNP
- M4 mounting holes
- TITLE:
- Document Number:
- 1700-0002_InterfaceBoard_RevA
- REV:
- Date:
- 7/13/2023 2:16:40 PM
- Sheet:
- 1

## Library data of the parts
1V2 3V3 5V 5VIN 5VMB !GNSSPWREN !GNSSVBEN !VB1FLT !VB2FLT !VB3FLT !VB4FLT -5VMB GNSS3V3 GNSSGND GNSSINT GNSSPLS GNSSRX GNSSTX GNSSVDDU MBPWREN PCVBUS TEMP_5V TMPWREN VBUS1-VBUS4 = TST_POINT_PTH_042-OCT: PART_DESC: PCB feature, test point, ID 42mil, OD 72mil; GateName_1: G$1; SymbolName_1: TST_POINT_PTH_042-OCT; LibraryName: TTECH; DeviceSetName: TST_POINT_PTH_042-OCT
5V_ON = LED_0603_LITE-ON_LTST-C193KRKT-2A: http://octopart.com/ltst-c190tbkt-lite-on-550003; PART_DESC: Red 629nm LED Indication - Discrete 1.9V 0603 (1608 Metric); GateName_1: G$1; SymbolName_1: LTST-C193KRKT-2A; LibraryName: TTECH; DeviceSetName: LED_0603_LITE-ON_LTST-C193KRKT-2A; MANUFACTURER: LITE-ON; MANUFACTURER_PART_NUMBER: LTST-C193KRKT-2A
C3 C12 C13 C34 C63 C64 C68 C69 = CAP_CER_0402_MURATA: MANUFACTURER: MURATA; MANUFACTURER_PART_NUMBER: GCM155R71C104KA55D; PART_DESC: CAP CER 0.1UF 16V X7R 0402; GateName_1: A; SymbolName_1: CAPH; LibraryName: TTECH; DeviceSetName: CAP_CER_0402_MURATA
C19 C20 C50 C59 C72 C73 = CAP_CER_0402_MURATA: MANUFACTURER: MURATA; MANUFACTURER_PART_NUMBER: GCM155C71A105KE38D; PART_DESC: CAP CER 1UF 10V X7S 0402; GateName_1: A; SymbolName_1: CAPH; LibraryName: TTECH; DeviceSetName: CAP_CER_0402_MURATA
C26 = CAP_CER_0603_TDK: MANUFACTURER: KEMET; MANUFACTURER_PART_NUMBER: C0603C103K4REC7867; PART_DESC: CAP CER 0603 10NF 16V X7R 10%; GateName_1: A; SymbolName_1: CAPH; LibraryName: TTECH; DeviceSetName: CAP_CER_0603_TDK
C32 C56 = CAP_CER_0603_TDK: MANUFACTURER: MURATA; MANUFACTURER_PART_NUMBER: GRM188R61A226ME15D; PART_DESC: CAP CER 22UF 10V X5R 0603; GateName_1: A; SymbolName_1: CAPH; LibraryName: TTECH; DeviceSetName: CAP_CER_0603_TDK
C33 C58 C62 C71 = CAP_CER_0402_MURATA: MANUFACTURER: DO NOT POPULATE; PART_DESC: (Murata GCM155C71A105KE38D) CAP CER 1UF 10V X7S 0402; GateName_1: A; SymbolName_1: CAPH; LibraryName: TTECH; DeviceSetName: CAP_CER_0402_MURATA; MANUFACTURER_PART_NUMBER: DO NOT POPULATE
C43 C54 C60 C61 C65-C67 = CAP_CER_0402_MURATA: MANUFACTURER: DO NOT POPULATE; PART_DESC: (Murata GCM155R71C104KA55D) CAP CER 0.1UF 16V X7R 0402; GateName_1: A; SymbolName_1: CAPH; LibraryName: TTECH; DeviceSetName: CAP_CER_0402_MURATA; MANUFACTURER_PART_NUMBER: DO NOT POPULATE
C51 C52 C70 = CAP_CER_0603_TDK: MANUFACTURER: DO NOT POPULATE; PART_DESC: (Murata GRM188R60J476ME15D) CAP CER 47UF 6.3V X5R 0603; GateName_1: A; SymbolName_1: CAPH; LibraryName: TTECH; DeviceSetName: CAP_CER_0603_TDK; MANUFACTURER_PART_NUMBER: DO NOT POPULATE
C74-C76 = CAP_CER_0402_MURATA: MANUFACTURER: MURATA; MANUFACTURER_PART_NUMBER: C1005X5R1A475K050BE; PART_DESC: CAP CER 4.7UF 10V X5R 0402; GateName_1: A; SymbolName_1: CAPH; LibraryName: TTECH; DeviceSetName: CAP_CER_0402_MURATA
C80 = CAP_CER_0603_TDK: MANUFACTURER: TDK; MANUFACTURER_PART_NUMBER: C0805X106M9RAC7800; PART_DESC: CAP CER 10UF 6.3V X7R 0805; GateName_1: A; SymbolName_1: CAPH; LibraryName: TTECH; DeviceSetName: CAP_CER_0603_TDK
CR1 = DIODE_TVS_BIDIRECT_COMCHIP: MANUFACTURER_PART_NUMBER: ACPDQC3V3HT-HF; PART_DESC: 7V (Typ) Clamp 17A (8/20µs) Ipp Tvs Diode Surface Mount 0402C/SOD-923F; GateName_1: G$1; SymbolName_1: DIODE_TVS_BIDIRECT; LibraryName: TTECH; DeviceSetName: DIODE_TVS_BIDIRECT_COMCHIP; MANUFACTURER: COMCHIP
GNSSPULSE = LED_0603: MANUFACTURER: DIALIGHT; MANUFACTURER_PART_NUMBER: 598-8081-107F; PART_DESC: LED GREEN CLEAR 0603 SMD; GateName_1: A; SymbolName_1: LED; LibraryName: TTECH; DeviceSetName: LED_0603; COPYRIGHT: Copyright (C) 2022 Ultra Librarian. All rights reserved.
J1 = CON_MOLEX_1053131306: PART_DESC: CONN HEADER R/A 6POS 2.5MM; GateName_1: A; SymbolName_1: CON_1053131306; LibraryName: TTECH; DeviceSetName: CON_MOLEX_1053131306
J2 = CON_MOLEX_1053141310: GateName_1: A; SymbolName_1: CON_1053141310; LibraryName: TTECH; DeviceSetName: CON_MOLEX_1053141310; MANUFACTURER: MANUFACTURER; MANUFACTURER_PART_NUMBER: MANUFACTURER_PART_NUMBER; PART_DESC: PART_DESC
J3 = CON_MOLEX_1053131303: PART_DESC: CONN HEADER R/A 3POS 2.5MM; GateName_1: A; SymbolName_1: CON_1053131303; LibraryName: TTECH; DeviceSetName: CON_MOLEX_1053131303; MANUFACTURER: MANUFACTURER; MANUFACTURER_PART_NUMBER: MANUFACTURER_PART_NUMBER
J4 = CON_3M_RA_N3314-5302RB: PART_DESC: Headers & Wire Housings 14P R/A SHORT PIN SOLDER TAIL 30u GOLD; GateName_1: G$1; SymbolName_1: CON_RA_3M_N3314-5302RB; LibraryName: TTECH; DeviceSetName: CON_3M_RA_N3314-5302RB; MANUFACTURER: MANUFACTURER; MANUFACTURER_PART_NUMBER: MANUFACTURER_PART_NUMBER
J5 = SAMTEC_SMA-J-P-X-ST-TH1_V.2: SMA STRAIGHT, THROUGH HOLE JACK- 50 OHM; PART_DESC: 50 Ohm SMA Jack Board Connector; GateName_1: G$1; SymbolName_1: SMA-J-P-X-ST-TH1; LibraryName: TTECH; DeviceSetName: SAMTEC_SMA-J-P-X-ST-TH1_V.2; MANUFACTURER: MANUFACTURER; MANUFACTURER_PART_NUMBER: MANUFACTURER_PART_NUMBER
J6 = CON_MOLEX_1053131304: PART_DESC: CONN HEADER R/A 4POS 2.5MM; GateName_1: A; SymbolName_1: CON_1053131304; LibraryName: TTECH; DeviceSetName: CON_MOLEX_1053131304; MANUFACTURER: MANUFACTURER; MANUFACTURER_PART_NUMBER: MANUFACTURER_PART_NUMBER
J7-J9 = CON_MOLEX_1054301305: PART_DESC: (Molex 1054301305) Headers & Wire Housings Nano-Fit 2.5mm RA Hdr SMT SR 5Ckt GW; GateName_1: A; SymbolName_1: CON_1054301305; LibraryName: TTECH; DeviceSetName: CON_MOLEX_1054301305; COPYRIGHT: Copyright (C) 2022 Ultra Librarian. All rights reserved.; MANUFACTURER_PART_NUMBER: DO NOT POPULATE
L1 = IND_TAIYO-YUDEN_NR3012T2R2M: MANUFACTURER: TAIYO YUDEN; PART_DESC: FIXED IND 2.2UH 1.2A 96 MOHM SMD; GateName_1: A; SymbolName_1: IND; LibraryName: TTECH; DeviceSetName: IND_TAIYO-YUDEN_NR3012T2R2M; COPYRIGHT: Copyright (C) 2022 Ultra Librarian. All rights reserved.; MANUFACTURER_PART_NUMBER: NR3012T2R2M
L2 = INDUCTOR_0603_TDK: MANUFACTURER: TDK; MANUFACTURER_PART_NUMBER: B82496C3270J000; PART_DESC: 27 nH Unshielded Drum Core, Wirewound Inductor 360 mA 550mOhm Max 0603 (1608 Metric); GateName_1: A; SymbolName_1: IND; LibraryName: TTECH; DeviceSetName: INDUCTOR_0603_TDK; COPYRIGHT: Copyright (C) 2023 Ultra Librarian. All rights reserved.
PTH1-PTH4 = PTH_M4_4.5MM-ID_MIDDLE-FIT: PART_DESC: PCB feature, PTH mounting (hole), M4; GateName_1: PTH; SymbolName_1: MNT-HOLE; LibraryName: TTECH; DeviceSetName: PTH_M4_4.5MM-ID_MIDDLE-FIT; MANUFACTURER: MANUFACTURER; MANUFACTURER_PART_NUMBER: MANUFACTURER_PART_NUMBER
Q1 Q5 = FDS4435BZ: MANUFACTURER: ONSEMI; PART_DESC: P-Channel 20 V 11.5A (Ta) 1W (Ta) Surface Mount 8-SOIC; GateName_1: A; SymbolName_1: FDS4435BZ; LibraryName: TTECH; DeviceSetName: FDS4435BZ; Pch: Pch
Q2 Q4 Q6 Q7 = MMBT2222ATT3G: MANUFACTURER: ONSEMI; PART_DESC: TRANS NPN 40V 0.6A SC75 SOT416; GateName_1: A; DESCRIPTION: Transistor, gen purpose, NPN; SymbolName_1: MMBT2222ATT3G; LibraryName: TTECH; DeviceSetName: MMBT2222ATT3G; MANUFACTURER_PART_NUMBER: MMBT2222ATT3G
Q3 = MOSFET_P-CH_VISHAY_SI2301CDS-T1-BE3: MANUFACTURER: VISHAY; PART_DESC: P-CHANNEL 20-V (D-S) MOSFET; GateName_1: A; SymbolName_1: SI2301CDS-T1-BE3; LibraryName: TTECH; DeviceSetName: MOSFET_P-CH_VISHAY_SI2301CDS-T1-BE3; D: D; G: G; S: S; COPYRIGHT: Copyright (C) 2022 Ultra Librarian. All rights reserved.
R1 R11 R35 R41 = RES_0402_VISHAY: RES SMD ... 0402; MANUFACTURER: VISHAY; MANUFACTURER_PART_NUMBER: CRCW04021K00FKEDC; PART_DESC: RES 1K OHM 1% 1/16W 0402; GateName_1: G$1; SymbolName_1: CRCW040210K0FKEDC; LibraryName: TTECH; DeviceSetName: RES_0402_VISHAY
R2 R3 = RES_0402_VISHAY: RES SMD ... 0402; MANUFACTURER: DO NOT POPULATE; PART_DESC: (TEConnn CRGCQ0402F27R)  RES 27 OHM 1% 1/16W 0402; GateName_1: G$1; SymbolName_1: CRCW040210K0FKEDC; LibraryName: TTECH; DeviceSetName: RES_0402_VISHAY; MANUFACTURER_PART_NUMBER: DO NOT POPULATE
R5 R6 R8 R9 R12 R13 R31 R44 R47-R50 = RES_0402_VISHAY: RES SMD ... 0402; MANUFACTURER: VISHAY; PART_DESC: RES 10K OHM 1% 1/16W 0402; GateName_1: G$1; SymbolName_1: CRCW040210K0FKEDC; LibraryName: TTECH; DeviceSetName: RES_0402_VISHAY; MANUFACTURER_PART_NUMBER: CRCW040210K0FKEDC
R7 = RES_0402_VISHAY: RES SMD ... 0402; MANUFACTURER: STACKPOLE; MANUFACTURER_PART_NUMBER: RMCF0402FT11K0; PART_DESC: RES 11K OHM 1% 1/16W 0402; GateName_1: G$1; SymbolName_1: CRCW040210K0FKEDC; LibraryName: TTECH; DeviceSetName: RES_0402_VISHAY
R10 = RES_0402_VISHAY: RES SMD ... 0402; MANUFACTURER: TECONN; MANUFACTURER_PART_NUMBER: CRGCQ0402F1M0; PART_DESC: RES 1M OHM 1% 1/16W 0402; GateName_1: G$1; SymbolName_1: CRCW040210K0FKEDC; LibraryName: TTECH; DeviceSetName: RES_0402_VISHAY
R22 = RES_0402_VISHAY: RES SMD ... 0402; MANUFACTURER: VISHAY; MANUFACTURER_PART_NUMBER: RCS040243K0FKED; PART_DESC: RES SMD 43K OHM 1% 1/5W 0402; GateName_1: G$1; SymbolName_1: CRCW040210K0FKEDC; LibraryName: TTECH; DeviceSetName: RES_0402_VISHAY
R23 = RES_0402_VISHAY: RES SMD ... 0402; MANUFACTURER: VISHAY; MANUFACTURER_PART_NUMBER: CRCW040249K9FKEDC; PART_DESC: RES 49.9K OHM 1% 1/16W 0402; GateName_1: G$1; SymbolName_1: CRCW040210K0FKEDC; LibraryName: TTECH; DeviceSetName: RES_0402_VISHAY
R25 R32 R40 = RES_0402_VISHAY: RES SMD ... 0402; MANUFACTURER: DO NOT POPULATE; PART_DESC: (Vishay CRCW0402330RFKEDC) RES 330 OHM 1% 1/16W 0402; GateName_1: G$1; SymbolName_1: CRCW040210K0FKEDC; LibraryName: TTECH; DeviceSetName: RES_0402_VISHAY; MANUFACTURER_PART_NUMBER: DO NOT POPULATE
R26-R28 R38 = RES_0402_VISHAY: RES SMD ... 0402; MANUFACTURER: DO NOT POPULATE; PART_DESC: (Vishay CRCW040210K0FKEDC) RES 10K OHM 1% 1/16W 0402; GateName_1: G$1; SymbolName_1: CRCW040210K0FKEDC; LibraryName: TTECH; DeviceSetName: RES_0402_VISHAY; MANUFACTURER_PART_NUMBER: DO NOT POPULATE
R29 R30 R58 = RES_0402_VISHAY: RES SMD ... 0402; MANUFACTURER: VISHAY; MANUFACTURER_PART_NUMBER: CRCW04020000Z0EDC; PART_DESC: RES 0 OHM JUMPER 1/16W 0402; GateName_1: G$1; SymbolName_1: CRCW040210K0FKEDC; LibraryName: TTECH; DeviceSetName: RES_0402_VISHAY
R33 = RES_0402_VISHAY: RES SMD ... 0402; MANUFACTURER: VISHAY; MANUFACTURER_PART_NUMBER: CRCW0402100RFKEDC; PART_DESC: RES 100 OHM 1% 1/16W 0402; GateName_1: G$1; SymbolName_1: CRCW040210K0FKEDC; LibraryName: TTECH; DeviceSetName: RES_0402_VISHAY
R37 R39 = RES_0402_VISHAY: RES SMD ... 0402; MANUFACTURER: VISHAY; MANUFACTURER_PART_NUMBER: CRCW0402100KFKEDC; PART_DESC: RES 100K OHM 1% 1/16W 0402; GateName_1: G$1; SymbolName_1: CRCW040210K0FKEDC; LibraryName: TTECH; DeviceSetName: RES_0402_VISHAY
R45 R46 = RES_0402_VISHAY: RES SMD ... 0402; MANUFACTURER: TECONN; MANUFACTURER_PART_NUMBER: CRGCQ0402F27R; PART_DESC: RES 27 OHM 1% 1/16W 0402; GateName_1: G$1; SymbolName_1: CRCW040210K0FKEDC; LibraryName: TTECH; DeviceSetName: RES_0402_VISHAY
R52-R55 = RES_0805_STACKPOLE: MANUFACTURER_PART_NUMBER: HCJ0805ZT0R00; PART_DESC: RES 0 OHM JUMPER 1/2W 0805; GateName_1: A; SymbolName_1: RES; LibraryName: TTECH; DeviceSetName: RES_0805_STACKPOLE; COPYRIGHT: Copyright (C) 2022 Ultra Librarian. All rights reserved.; MANUFACTURER: STACKPOLE
R56 = RES_0402_VISHAY: RES SMD ... 0402; MANUFACTURER: VISHAY; MANUFACTURER_PART_NUMBER: CRCW04021K30FKED; PART_DESC: RES SMD 1.3K OHM 1% 1/16W 0402; GateName_1: G$1; SymbolName_1: CRCW040210K0FKEDC; LibraryName: TTECH; DeviceSetName: RES_0402_VISHAY
R57 = RES_0603_STACKPOLE: MANUFACTURER: VISHAY; MANUFACTURER_PART_NUMBER: TNPW060310R0FHTA; PART_DESC: RES 10 OHM 1% 1/10W 0603; GateName_1: A; SymbolName_1: RES; LibraryName: TTECH; DeviceSetName: RES_0603_STACKPOLE; COPYRIGHT: Copyright (C) 2022 Ultra Librarian. All rights reserved.; PACKAGE: (0603)
U1 U14 U15 = TI_LP5907MFX-3.3/NOPBDBV0005A_L: PART_DESC: IC REG LINEAR 3.3V 250MA SOT23-5; GateName_1: A; SymbolName_1: LP5907-1P2DBV; DeviceName: DBV0005A_L; LibraryName: TTECH; DeviceSetName: TI_LP5907MFX-3.3/NOPB; GND: GND; COPYRIGHT: Copyright (C) 2022 Ultra Librarian. All rights reserved.
U2 = TI_SW-REG_LM3671: PART_DESC: IC REG BUCK 1.2V 600MA SOT23-5; GateName_1: A; SymbolName_1: LM3671QMF-1.2/NOPB; LibraryName: TTECH; DeviceSetName: TI_SW-REG_LM3671; COPYRIGHT: Copyright (C) 2022 Ultra Librarian. All rights reserved.
U3 = TVS_ALPHA-OEGA_AOZ8904CIL: PART_DESC: TVS DIODE 5.5VWM 18VC SOT23-6; GateName_1: A; SymbolName_1: AOZ8904CIL; LibraryName: TTECH; DeviceSetName: TVS_ALPHA-OEGA_AOZ8904CIL; CH1: CH1; CH2: CH2; VP: VP; VN: VN; CH3: CH3; CH4: CH4; COPYRIGHT: Copyright (C) 2022 Ultra Librarian. All rights reserved.
U4 = MAXIM_MAX3311EEUB+T: PART_DESC: IC TRANSCEIVER FULL 1/1 10UMAX; GateName_1: A; SymbolName_1: MAX3311EEUB; LibraryName: TTECH; DeviceSetName: MAXIM_MAX3311EEUB+T; COPYRIGHT: Copyright (C) 2022 Ultra Librarian. All rights reserved.
U5 = MAXIM_MAX889RESA: PART_DESC: Charge Pump Switching Regulator IC Negative Adjustable -2.5V 1 Output 200mA 8-SOIC (0.154, 3.90mm Width); GateName_1: A; SymbolName_1: MAX889RESA; LibraryName: TTECH; DeviceSetName: MAXIM_MAX889RESA
U6 = MAX3080EESD+: PART_DESC: IC TRANSCEIVER FULL 1/1 14SOIC; GateName_1: A; SymbolName_1: MAX3080EESD+; LibraryName: TTECH; DeviceSetName: MAX3080EESD+
U7-U9 = TVS_ALPHA-OEGA_AOZ8904CIL: PART_DESC: (Alpha & Omega AOZ8904CIL) TVS DIODE 5.5VWM 18VC SOT23-6; GateName_1: A; SymbolName_1: AOZ8904CIL; LibraryName: TTECH; DeviceSetName: TVS_ALPHA-OEGA_AOZ8904CIL; CH1: CH1; CH2: CH2; VP: VP; VN: VN; CH3: CH3; CH4: CH4; COPYRIGHT: Copyright (C) 2022 Ultra Librarian. All rights reserved.; MANUFACTURER: DO NOT POPULATE
U10-U13 = SW_PWR_1CH_DIODES-INC_AP22816BKAWT: PART_DESC: (Diodes, Inc. AP22816BKAWT-7) USB Switch ICs USB Power Switch TSOT25; GateName_1: G$1; SymbolName_1: SW_PWR_DIODES-INC_AP22816; LibraryName: TTECH; DeviceSetName: SW_PWR_1CH_DIODES-INC_AP22816BKAWT; GND: GND; 1A: 1A; (KA): (KA); MANUFACTURER: DO NOT POPULATE
U16 = MODULE_UBLOX_NEO-M8Q-01A: GateName_1: A; SymbolName_1: MODULE_UBLOX_NEO-M8Q-01A; LibraryName: TTECH; DeviceSetName: MODULE_UBLOX_NEO-M8Q-01A; 1: 1; (default): (default)